# Altium project LM5122_DC_Boost.PrjPcb
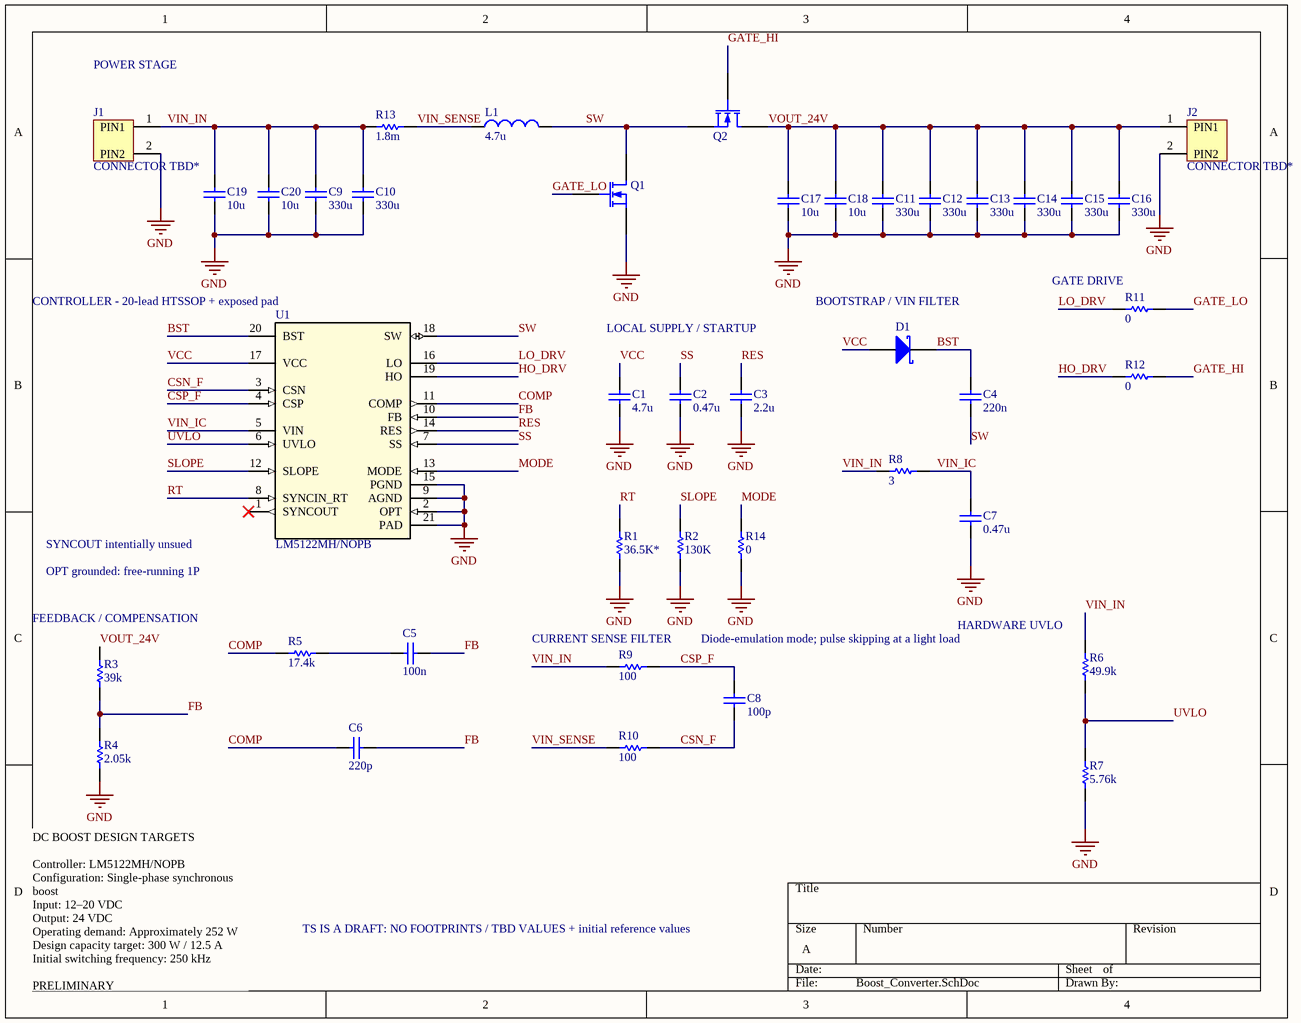
[diagram p0: Boost_Converter.SchDoc]
1 sheet, 41 parts. Net scope: global (net labels, ports and power ports of the same name join across sheets).

## Sheet Boost_Converter.SchDoc
size A; SheetNumber: 1; SheetTotal: 1

### Parts
C1  value 4.7u  (hidden comment: Capacitor)
C2  value 0.47u  (hidden comment: Capacitor)
C3  value 2.2u  (hidden comment: Capacitor)
C4  value 220n  (hidden comment: Capacitor)
C5  value 100n  (hidden comment: Capacitor)
C6  value 220p  (hidden comment: Capacitor)
C7  value 0.47u  (hidden comment: Capacitor)
C8  value 100p  (hidden comment: Capacitor)
C9  value 330u  (hidden comment: Capacitor)
C10  value 330u  (hidden comment: Capacitor)
C11  value 330u  (hidden comment: Capacitor)
C12  value 330u  (hidden comment: Capacitor)
C13  value 330u  (hidden comment: Capacitor)
C14  value 330u  (hidden comment: Capacitor)
C15  value 330u  (hidden comment: Capacitor)
C16  value 330u  (hidden comment: Capacitor)
C17  value 10u  (hidden comment: Capacitor)
C18  value 10u  (hidden comment: Capacitor)
C19  value 10u  (hidden comment: Capacitor)
C20  value 10u  (hidden comment: Capacitor)
D1  Schottky Diode  (value not drawn)
J1  CONNECTOR TBD*
J2  CONNECTOR TBD*
L1  value 4.7u  (hidden comment: Inductor)
Q1  N-channel Power MOSFET VDMOS Model  (value not drawn)
Q2  N-channel Power MOSFET VDMOS Model  (value not drawn)
R1  value 36.5K*  (hidden comment: Resistor)
R2  value 130K  (hidden comment: Resistor)
R3  value 39k  (hidden comment: Resistor)
R4  value 2.05k  (hidden comment: Resistor)
R5  value 17.4k  (hidden comment: Resistor)
R6  value 49.9k  (hidden comment: Resistor)
R7  value 5.76k  (hidden comment: Resistor)
R8  value 3  (hidden comment: Resistor)
R9  value 100  (hidden comment: Resistor)
R10  value 100  (hidden comment: Resistor)
R11  value 0  (hidden comment: Resistor)
R12  value 0  (hidden comment: Resistor)
R13  value 1.8m  (hidden comment: Resistor)
R14  value 0  (hidden comment: Resistor)
U1  LM5122MH/NOPB  [PWP0020A_N]

### Nets
GND: C1.1 C2.1 C3.1 C7.1 C9.1 C10.1 C11.1 C12.1 C13.1 C14.1 C15.1 C16.1 C17.1 C18.1 C19.1 C20.1 J1.2(PIN2) J2.2(PIN2) Q1.3(S) R1.1 R2.1 R4.1 R7.1 R14.1 U1.2(OPT) U1.9(AGND) U1.15(PGND) U1.21(PAD)
BST: C4.2 D1.2(K) U1.20(BST)
COMP: C6.1 R5.1 U1.11(COMP)
CSN_F: C8.1 R10.2 U1.3(CSN)
CSP_F: C8.2 R9.2 U1.4(CSP)
FB: C5.2 C6.2 R3.1 R4.2 U1.10(FB)
GATE_HI: Q2.2(G) R12.2
GATE_LO: Q1.2(G) R11.2
HO_DRV: R12.1 U1.19(HO)
LO_DRV: R11.1 U1.16(LO)
MODE: R14.2 U1.13(MODE)
RES: C3.2 U1.14(RES)
RT: R1.2 U1.8(SYNCIN_RT)
SLOPE: R2.2 U1.12(SLOPE)
SS: C2.2 U1.7(SS)
SW: C4.1 L1.2 Q1.1(D) Q2.3(S) U1.18(SW)
UVLO: R6.1 R7.2 U1.6(UVLO)
VCC: C1.2 D1.1(A) U1.17(VCC)
VIN_IC: C7.2 R8.2 U1.5(VIN)
VIN_IN: C9.2 C10.2 C19.2 C20.2 J1.1(PIN1) R6.2 R8.1 R9.1 R13.1
VIN_SENSE: L1.1 R10.1 R13.2
VOUT_24V: C11.2 C12.2 C13.2 C14.2 C15.2 C16.2 C17.2 C18.2 J2.1(PIN1) Q2.1(D) R3.2
NetC5_1: C5.1 R5.2

Not connected (* = marked no-connect by the designer): U1 1(SYNCOUT)*

### Notes on the sheet
- POWER STAGE
- (near R11) GATE DRIVE
- (near U1) CONTROLLER - 20-lead HTSSOP + exposed pad
- LOCAL SUPPLY / STARTUP
- (near D1) BOOTSTRAP / VIN FILTER
- SYNCOUT intentially unsued
- (near R3) FEEDBACK / COMPENSATION
- OPT grounded: free-running 1P
- (near R9) CURRENT SENSE FILTER
- Diode-emulation mode; pulse skipping at a light load
- (near R6) HARDWARE UVLO
- TS IS A DRAFT: NO FOOTPRINTS / TBD VALUES + initial reference values
- DC BOOST DESIGN TARGETS
  Controller: LM5122MH/NOPB
  Configuration: Single-phase synchronous boost
  Input: 12–20 VDC
  Output: 24 VDC
  Operating demand: Approximately 252 W
  Design capacity target: 300 W / 12.5 A
  Initial switching frequency: 250 kHz
  PRELIMINARY
  Component values and continuous power rating
  require calculation and testing.

### Library data of the parts
C1 C5 C6 C9-C20 = Capacitor: SimulationGenericComponent: True
C2 = Capacitor: Capacitor, slower startup; SimulationGenericComponent: True
C3 = Capacitor: Capacitor, restart-timing choice; SimulationGenericComponent: True
C4 = Capacitor: Capacitor, 50 V, ceramic X7R; SimulationGenericComponent: True
C7 = Capacitor: Capacitor, 50 V X7R, controller supply bypass; SimulationGenericComponent: True
C8 = Capacitor: Capacitor, C0G/NP0, differential noise filtering; SimulationGenericComponent: True
D1 = Schottky Diode: AF: 1; BV: 0; BV_MAX: 1e99; EG: 1.11; FC: 0.5; IBV: 0.001; IS: 1e-14; MJSW: 0.33; NTUN: 30; TNOM: 27; XTI: 3; SimulationGenericComponent: True; CJO: 0; CJP: 0; CTA: 0; CTP: 0; FCS: 0.5; FV_MAX: 1e99; IKF: 0; IKR: 0; ISR: 1e-14; JSW: 0; JTUN: 0; JTUNSW: 0; KEG: 1; KF: 0; LEVEL: 1; N: 1; NBV: 1; NR: 1; NS: 1; PHP: 1; RS: 0; TCV: 0; TLEV: 0; TLEVC: 0; TM1: 0; TM2: 0; TPB: 0; TPHP: 0; TRS: 0; TRS2: 0; TT: 0; TTT1: 0; TTT2: 0; VJ: 1; XTITUN: 3
J1 J2 = CONN_2PIN_DRAFT: Two-pin connector placeholder; physical part and footprint TBD
L1 = Inductor: SimulationGenericComponent: True
Q1 Q2 = MOSFET N-ch VDMOS: XTI: 0; A: 1; BV: 1e30; EG: 1.11; FC: 0.5; IBV: 1e-10; IS: 1e-14; PHI: 0.6; TNOM: 27; VJ: 0.8; SimulationGenericComponent: True; CGDMAX: 0; CGDMIN: 0; CGS: 0; CJO: 0; KP: 1; KSUBTHRES: 0; LAMBDA: 0; M: 0.5; MTRIODE: 1; N: 1; NBV: 1; NCHAN: 1; RB: 0; RD: 0; RDS: 1e30; RG: 0; RQ: 0; RS: 0; SUBSHIFT: 0; SUBSLOPE: 0; THETA: 0; TT: 0; VQ: 0; VTO: 0
R1 R5 R13 = Resistor: TC1: 0; SimulationGenericComponent: True; TC2: 0
R2 = Resistor: Resistor, 1% tolerance; TC1: 0; SimulationGenericComponent: True; TC2: 0
R3 = Resistor: Resistor, 1%, upper feedback resistor; TC1: 0; SimulationGenericComponent: True; TC2: 0
R4 = Resistor: Resistor, 1%, lower feedback resistor; TC1: 0; SimulationGenericComponent: True; TC2: 0
R6 R7 = Resistor: Resistor,  0.1%, ≥0.1 W; TC1: 0; SimulationGenericComponent: True; TC2: 0
R8 = Resistor: Resistor, controller supply filtering; TC1: 0; SimulationGenericComponent: True; TC2: 0
R9 = Resistor: Resistor, balanced current-sense filtering; TC1: 0; SimulationGenericComponent: True; TC2: 0
R10 = Resistor: Resistor, balanced current sense filtering; TC1: 0; SimulationGenericComponent: True; TC2: 0
R11 R12 R14 = Resistor: SimulationGenericComponent: True; TC1: 0; TC2: 0
U1 = LM5122MHNOPB: 3-65V Wide Vin, Current Mode Synchronous Boost Controller with Multiphase Capability 20-HTSSOP -40 to 125; Manufacturer_Name: Texas Instruments; CompType: IC; TYPE: TYPE; RefDes: RefDes; Copyright: Copyright (C) 2025 Ultra Librarian. All rights reserved.; Manufacturer_Part_Number: LM5122MH/NOPB; Application_BuildNumber: *; PartNumber: LM5122MH/NOPB; PackageReference: PWP0020A; MountType: SMT; RoHS: Y; Manufacturer: Texas Instruments